# Altium schematic sheet pca20072_cover.SchDoc: nRF54L15 Tag - Cover
size A4; Organization: Nordic Semiconductor; DocumentNumber: 1; SheetNumber: 1; SheetTotal: 5; CompanyName: Nordic Semiconductor; DocumentSize: A4
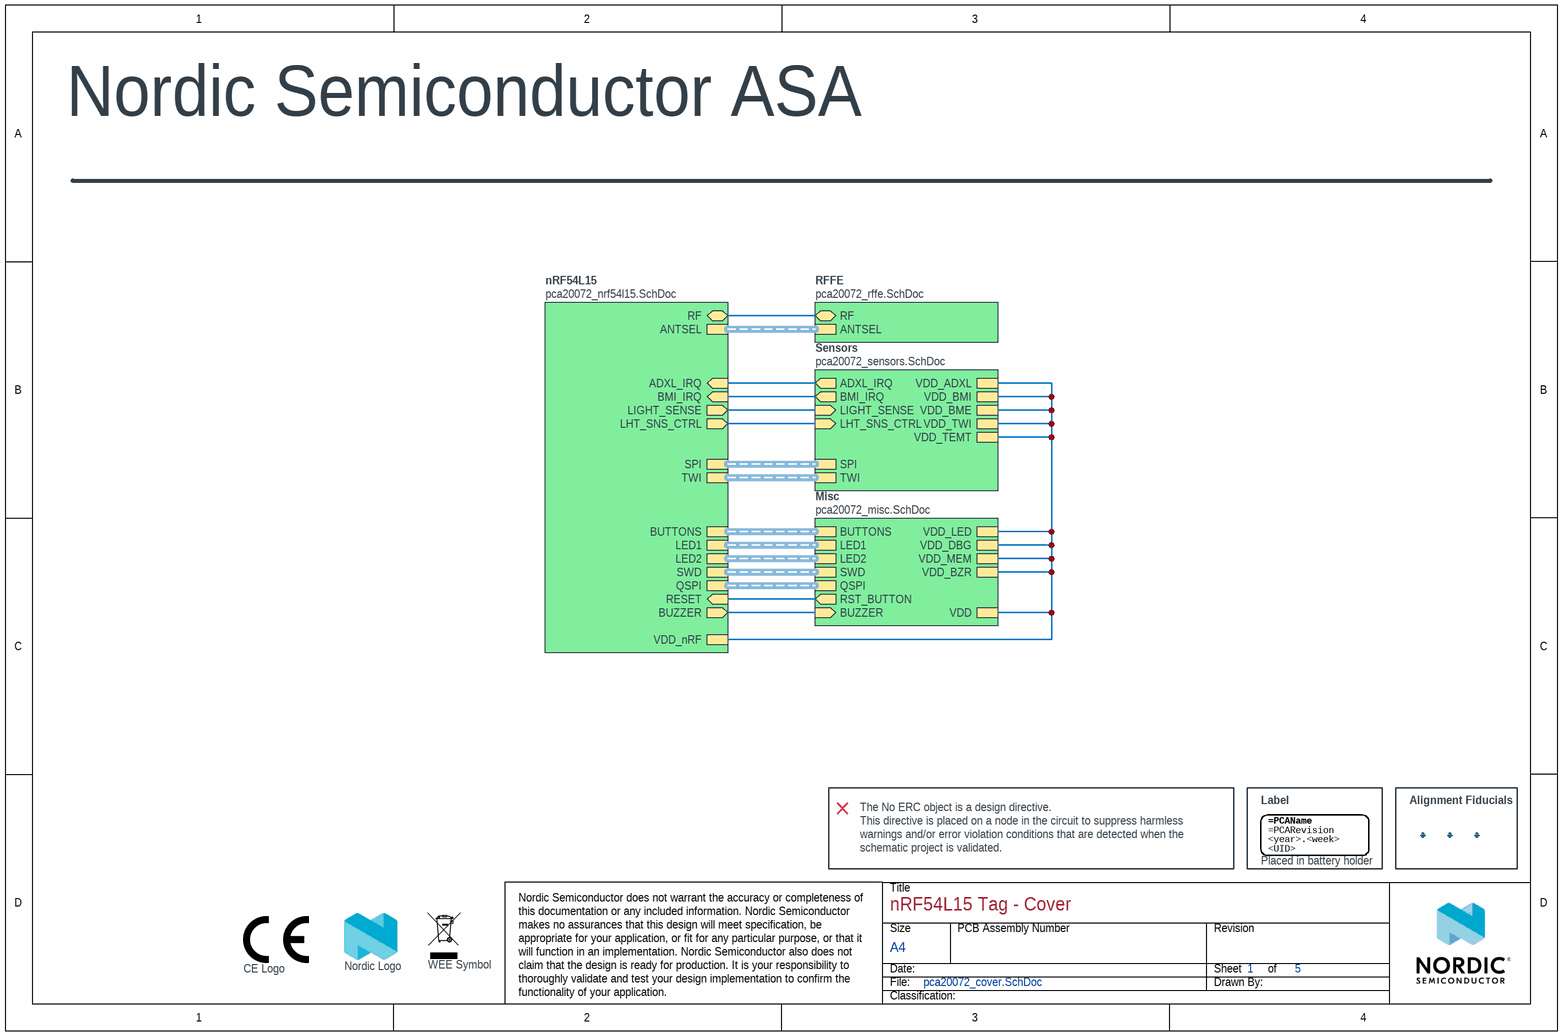
[diagram p0: pca20072_cover.SchDoc]

## Parts
Fid1  Fiducial mark  [Fiducial]  (value not drawn)
Fid2  Fiducial mark  [Fiducial]  (value not drawn)
Fid3  Fiducial mark  [Fiducial]  (value not drawn)
LABEL1  Assembly: Placed in battery holder  [LabelSilk_8x8]  (hidden comment: 8x8mm)
LOGO1  WEE Symbol  [WEEE_3x4.5mm]  (no BOM)
LOGO2  Nordic Logo  [NORDIC_LOGO_LYING]  (no BOM)
LOGO3  CE Logo  [CE_logo]  (no BOM)

## Blocks framed on the sheet
Label: LABEL1
Alignment Fiducials: Fid1-Fid3

## Sub-sheets
Misc = pca20072_misc.SchDoc: BUTTONS (harness BUTTON), QSPI (harness QSPI), LED1 (harness LED), SWD (harness SWD), VDD_MEM, VDD_LED, VDD_DBG, LED2 (harness LED), BUZZER (in), VDD_BZR, RST_BUTTON (out), VDD
nRF54L15 = pca20072_nrf54l15.SchDoc: BUTTONS (harness BUTTON), LED1 (harness LED), SWD (harness SWD), RESET (in), RF (bidir), ANTSEL (harness ANT), QSPI (harness QSPI), ADXL_IRQ (in), BMI_IRQ (in), SPI (harness SPI), TWI (harness TWI), VDD_nRF, LHT_SNS_CTRL (out), LED2 (harness LED), LIGHT_SENSE (out), BUZZER (out)
RFFE = pca20072_rffe.SchDoc: RF (bidir), ANTSEL (harness ANT)
Sensors = pca20072_sensors.SchDoc: ADXL_IRQ (out), BMI_IRQ (out), SPI (harness SPI), TWI (harness TWI), VDD_BMI, VDD_ADXL, VDD_BME, VDD_TWI, LIGHT_SENSE (in), LHT_SNS_CTRL (in), VDD_TEMT

## Nets
(unnamed): sheet nRF54L15/RESET, sheet Misc/RST_BUTTON
(unnamed): sheet nRF54L15/RF, sheet RFFE/RF
(unnamed): sheet nRF54L15/ADXL_IRQ, sheet Sensors/ADXL_IRQ
(unnamed): sheet nRF54L15/BMI_IRQ, sheet Sensors/BMI_IRQ
(unnamed): sheet nRF54L15/VDD_nRF, sheet Sensors/VDD_BMI, sheet Sensors/VDD_ADXL, sheet Sensors/VDD_BME, sheet Sensors/VDD_TWI, sheet Sensors/VDD_TEMT, sheet Misc/VDD_MEM, sheet Misc/VDD_LED, sheet Misc/VDD_DBG, sheet Misc/VDD_BZR, sheet Misc/VDD
(unnamed): sheet nRF54L15/LHT_SNS_CTRL, sheet Sensors/LHT_SNS_CTRL
(unnamed): sheet nRF54L15/LIGHT_SENSE, sheet Sensors/LIGHT_SENSE
(unnamed): sheet nRF54L15/BUZZER, sheet Misc/BUZZER

## Buses and harness runs
harness sheet Misc/BUTTONS = sheet nRF54L15/BUTTONS
harness sheet Misc/LED1 = sheet nRF54L15/LED1
harness sheet Misc/LED2 = sheet nRF54L15/LED2
harness sheet Misc/QSPI = sheet nRF54L15/QSPI
harness sheet Misc/SWD = sheet nRF54L15/SWD
harness sheet nRF54L15/ANTSEL = sheet RFFE/ANTSEL
harness sheet nRF54L15/SPI = sheet Sensors/SPI
harness sheet nRF54L15/TWI = sheet Sensors/TWI

## Notes on the sheet
- (near LABEL1) The No ERC object is a design directive.
  This directive is placed on a node in the circuit to suppress harmless warnings and/or error violation conditions that are detected when the schematic project is validated.
- Nordic Semiconductor ASA
- Title
- Size
- Date:
- File:
- A4
- PCB Assembly Number
- Sheet
- Drawn By:
- Revision
- of
- Nordic Semiconductor does not warrant the accuracy or completeness of this documentation or any included information. Nordic Semiconductor makes no assurances that this design will meet specification, be appropriate for your application, or fit for any particular purpose, or that it will function in an implementation. Nordic Semiconductor also does not claim that the design is ready for production. It is your responsibility to thoroughly validate and test your design implementation to confirm the functionality of your application.
  © Nordic Semiconductor — All rights reserved.
- Classification:
- (in symbol Label_8x8) <year>.<week>; <UID>

## Library data of the parts
Fid1-Fid3 = Fid-Mark: Manufacturer: N.A.; Part number NEMS: 100500073; Value: N.A.; Pad Count: 1; Component Status: Active; System: Connector; Part Number: Fid-Mark; Manufacturer Part Number: N.A.; LatestRevisionDate: 2009-12-12; Published: 2009-12-12; Note: N.A.; Artikkelnr Noca: N.A.; Footprint Doc: Fiducial; PartId: 100500073; Component Class: Connectors; Author: rsk; ComponentLink1URL: N.A.; ComponentLink1Description: Datasheet; ComponentLink2URL: N.A.; ComponentLink2Description: Supplier link; HelpURL: N.A.; Supplier 1: N.A.; Supplier Part Number 1: N.A.; Supplier 2: N.A.; Supplier Part Number 2: N.A.; Part number IPS: N.A.; Part number Norautron: N.A.
LABEL1 = Label_8x8: PCA version label, stick-on, 8x8mm; Manufacturer: Ellco Etikett; Manufacturer Part Number: A33511-01; Part number NEMS: 101200025; Component Status: Active; Pad Count: 0; Note: N.A.; Part Number: Label_8x8; PartId: 101200025; Component Class: Mechanicals; Author: hany; ComponentLink1URL: N.A.; ComponentLink1Description: Datasheet; ComponentLink2URL: N.A.; ComponentLink2Description: Supplier link; HelpURL: N.A.; LatestRevisionDate: 2023-01-05; Published: 2023-01-05; Footprint Doc: Label; Value: 8x8mm; Supplier 1: N.A.; Supplier Part Number 1: N.A.; Supplier 2: N.A.; Supplier Part Number 2: N.A.; Artikkelnr Noca: N.A.; Part number IPS: N.A.; Part number Norautron: N.A.
LOGO1 = WEEE Symbol 3x4.5mm: WEEE Directive symbol; Manufacturer: N.A.; Part number NEMS: 101100006; Component Status: Active; Pad Count: 0; Part Number: WEEE Symbol 3x4.5mm; PartId: 101100006; Component Class: Markings; Author: rsk; Manufacturer Part Number: N.A.; ComponentLink1URL: N.A.; ComponentLink1Description: Datasheet; ComponentLink2URL: N.A.; ComponentLink2Description: Supplier link; HelpURL: N.A.; LatestRevisionDate: 2023-03-07; Published: 2016-09-07; Footprint Doc: WEEE_3x4.5mm; Value: WEE Symbol; Note: N.A.; Supplier 1: N.A.; Supplier Part Number 1: N.A.; Supplier 2: N.A.; Supplier Part Number 2: N.A.; Artikkelnr Noca: N.A.; Part number IPS: N.A.; Part number Norautron: N.A.
LOGO2 = Nordic Logo lying: Manufacturer: N.A.; Part number NEMS: 101100001; Component Status: Active; Pad Count: 0; Part Number: Nordic Logo lying; PartId: 101100001; Component Class: Markings; Author: rsk; Manufacturer Part Number: N.A.; ComponentLink1URL: N.A.; ComponentLink1Description: Datasheet; ComponentLink2URL: N.A.; ComponentLink2Description: Supplier link; HelpURL: N.A.; LatestRevisionDate: 2017-03-20; Published: 2017-09-01; Footprint Doc: Nordic Logo; Value: Nordic Logo; Note: N.A.; Supplier 1: N.A.; Supplier Part Number 1: N.A.; Supplier 2: N.A.; Supplier Part Number 2: N.A.; Artikkelnr Noca: N.A.; Part number IPS: N.A.; Part number Norautron: N.A.
LOGO3 = CE_logo: CE (Conformité_Européenne) logo; Manufacturer: N.A.; Part number NEMS: 101100010; Component Status: Active; Pad Count: 0; Part Number: CE_logo; PartId: 101100010; Component Class: Markings; Author: daba; Manufacturer Part Number: N.A.; ComponentLink1URL: N.A.; ComponentLink1Description: Datasheet; ComponentLink2URL: N.A.; ComponentLink2Description: Supplier link; HelpURL: N.A.; LatestRevisionDate: 2024-11-26; Published: 2024-11-26; Footprint Doc: CE_logo; Value: CE Logo; Note: N.A.; Supplier 1: N.A.; Supplier Part Number 1: N.A.; Supplier 2: N.A.; Supplier Part Number 2: N.A.; Artikkelnr Noca: N.A.; Part number IPS: N.A.; Part number Norautron: N.A.